# Altium project Baseboard-v2.1.PrjPcb (part 6 of 6)
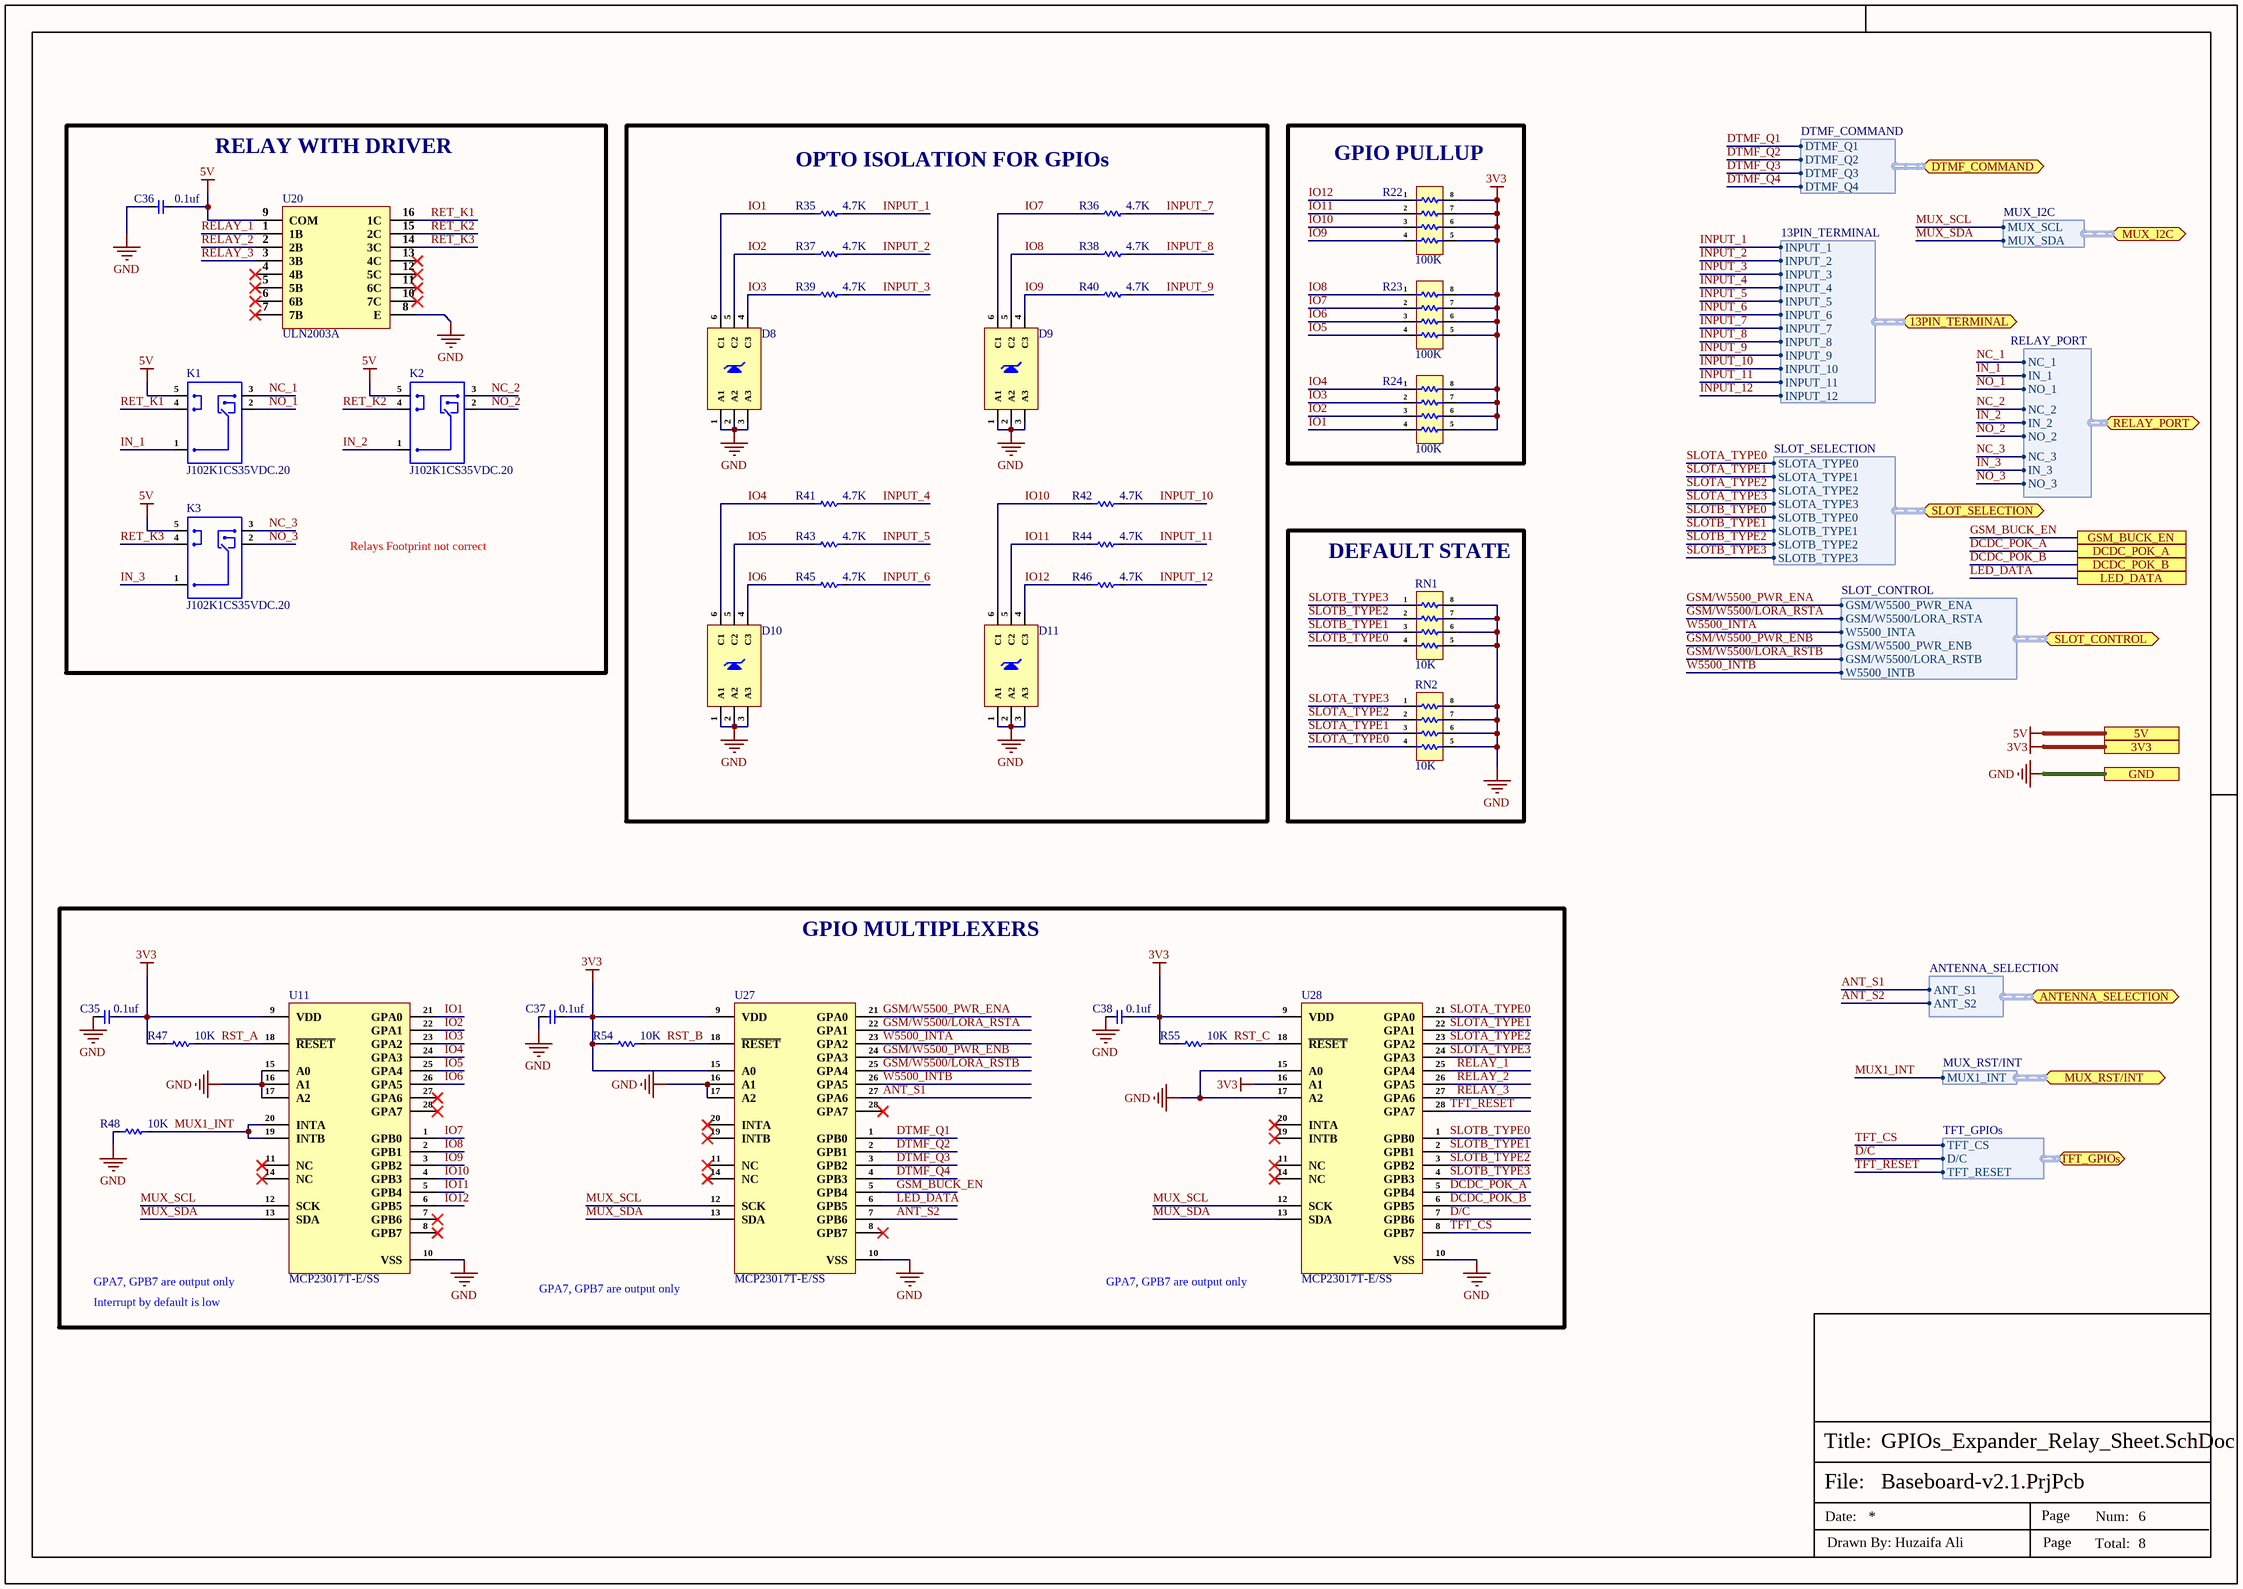
[diagram p8: GPIOs_Expander_Relay_Sheet.SchDoc]

## Nets that join several sheets
3V3: Power_Sheet (5 pins), RS485_RS232_Sheet (13 pins), mPCIe_Connector_Sheet (6 pins), Controller_Sheet (26 pins), GPIOs_Expander_Relay_Sheet (23 pins)
5V: Power_Sheet (11 pins), DTMF_Decoder_Sheet (C32.2 U8.11 U8.20), mPCIe_Connector_Sheet (J20.46 J20.48 J21.46 J21.48), Controller_Sheet (J12.1), GPIOs_Expander_Relay_Sheet (5 pins)
5V_USB: Connector (FB1.2), Power_Sheet (P3.1 U2.6)
GND: Connector (13 pins), Power_Sheet (30 pins), DTMF_Decoder_Sheet (5 pins), RS485_RS232_Sheet (15 pins), mPCIe_Connector_Sheet (48 pins), Controller_Sheet (37 pins), GPIOs_Expander_Relay_Sheet (36 pins)
GSM_PWR: Power_Sheet (7 pins), mPCIe_Connector_Sheet (J20.2 J21.2)
VCC: Connector (D2.2 F2.2 R3.1), Power_Sheet (5 pins)
13PIN_TERMINAL.INPUT_1: Connector (J4.1), GPIOs_Expander_Relay_Sheet (R35.1)
13PIN_TERMINAL.INPUT_2: Connector (J4.2), GPIOs_Expander_Relay_Sheet (R37.1)
13PIN_TERMINAL.INPUT_3: Connector (J4.3), GPIOs_Expander_Relay_Sheet (R39.1)
13PIN_TERMINAL.INPUT_4: Connector (J6.1), GPIOs_Expander_Relay_Sheet (R41.1)
13PIN_TERMINAL.INPUT_5: Connector (J6.2), GPIOs_Expander_Relay_Sheet (R43.1)
13PIN_TERMINAL.INPUT_6: Connector (J6.3), GPIOs_Expander_Relay_Sheet (R45.1)
13PIN_TERMINAL.INPUT_7: Connector (J8.1), GPIOs_Expander_Relay_Sheet (R36.1)
13PIN_TERMINAL.INPUT_8: Connector (J8.2), GPIOs_Expander_Relay_Sheet (R38.1)
13PIN_TERMINAL.INPUT_9: Connector (J8.3), GPIOs_Expander_Relay_Sheet (R40.1)
13PIN_TERMINAL.INPUT_10: Connector (J9.1), GPIOs_Expander_Relay_Sheet (R42.1)
13PIN_TERMINAL.INPUT_11: Connector (J9.2), GPIOs_Expander_Relay_Sheet (R44.1)
13PIN_TERMINAL.INPUT_12: Connector (J11.1), GPIOs_Expander_Relay_Sheet (R46.1)
ANT_S1: Controller_Sheet (R85.1), GPIOs_Expander_Relay_Sheet (U27.27)
ANT_S2: Controller_Sheet (R86.1), GPIOs_Expander_Relay_Sheet (U27.7)
D/C: Controller_Sheet (J12.15), GPIOs_Expander_Relay_Sheet (U28.7)
DCDC_POK_A: mPCIe_Connector_Sheet (J21.8), GPIOs_Expander_Relay_Sheet (U28.5)
DCDC_POK_B: mPCIe_Connector_Sheet (J20.8), GPIOs_Expander_Relay_Sheet (U28.6)
DTMF+: Connector (J14.2), DTMF_Decoder_Sheet (C33.2 R88.2)
DTMF-: Connector (J14.1), DTMF_Decoder_Sheet (C34.2 R89.2)
DTMF_PWM: DTMF_Decoder_Sheet (R91.2), Controller_Sheet (U6.48)
DTMF_Q1: DTMF_Decoder_Sheet (U8.12), GPIOs_Expander_Relay_Sheet (U27.1)
DTMF_Q2: DTMF_Decoder_Sheet (U8.13), GPIOs_Expander_Relay_Sheet (U27.2)
DTMF_Q3: DTMF_Decoder_Sheet (U8.14), GPIOs_Expander_Relay_Sheet (U27.3)
DTMF_Q4: DTMF_Decoder_Sheet (U8.15), GPIOs_Expander_Relay_Sheet (U27.4)
DTMF_STD: DTMF_Decoder_Sheet (U8.17), Controller_Sheet (U6.43)
GSM/W5500/LORA_RSTA: mPCIe_Connector_Sheet (J21.7), GPIOs_Expander_Relay_Sheet (U27.22)
GSM/W5500/LORA_RSTB: mPCIe_Connector_Sheet (J20.7), GPIOs_Expander_Relay_Sheet (U27.25)
GSM/W5500_PWR_ENA: mPCIe_Connector_Sheet (J21.1), GPIOs_Expander_Relay_Sheet (U27.21)
GSM/W5500_PWR_ENB: mPCIe_Connector_Sheet (J20.1), GPIOs_Expander_Relay_Sheet (U27.24)
GSM_BUCK_EN: Power_Sheet (R13.2 U4.1), GPIOs_Expander_Relay_Sheet (U27.5)
IN_1: Connector (J1.2), GPIOs_Expander_Relay_Sheet (K1.1)
IN_2: Connector (J2.2), GPIOs_Expander_Relay_Sheet (K2.1)
IN_3: Connector (J7.2), GPIOs_Expander_Relay_Sheet (K3.1)
LED_DATA: Controller_Sheet (J12.8), GPIOs_Expander_Relay_Sheet (U27.6)
LORA_IO0: mPCIe_Connector_Sheet (J20.10 J21.10), Controller_Sheet (U6.13)
MUX1_INT: Controller_Sheet (U6.14), GPIOs_Expander_Relay_Sheet (R48.1 U11.19 U11.20)
MUX_I2C.MUX_SCL: mPCIe_Connector_Sheet (J20.30 J21.30), Controller_Sheet (R16.1 U6.45), GPIOs_Expander_Relay_Sheet (U11.12 U27.12 U28.12)
MUX_I2C.MUX_SDA: mPCIe_Connector_Sheet (J20.32 J21.32), Controller_Sheet (R15.1 U6.44), GPIOs_Expander_Relay_Sheet (U11.13 U27.13 U28.13)
NC_1: Connector (J1.1), GPIOs_Expander_Relay_Sheet (K1.3)
NC_2: Connector (J2.1), GPIOs_Expander_Relay_Sheet (K2.3)
NC_3: Connector (J7.1), GPIOs_Expander_Relay_Sheet (K3.3)
NO_1: Connector (J1.3), GPIOs_Expander_Relay_Sheet (K1.2)
NO_2: Connector (J2.3), GPIOs_Expander_Relay_Sheet (K2.2)
NO_3: Connector (J7.3), GPIOs_Expander_Relay_Sheet (K3.2)
RE/DE/RS485: RS485_RS232_Sheet (U33.2), Controller_Sheet (U6.22)
RS232_RX: Connector (J13.2), RS485_RS232_Sheet (F22.1)
RS232_TX: Connector (J13.3), RS485_RS232_Sheet (F19.1)
RS485_N: Connector (J10.2), RS485_RS232_Sheet (F20.2)
RS485_P: Connector (J10.3), RS485_RS232_Sheet (F21.2)
RXD/RS485/RS232: RS485_RS232_Sheet (R79.2), Controller_Sheet (U6.23)
RXD/SLOTB_UART_RX: mPCIe_Connector_Sheet (J20.11), Controller_Sheet (J17.4 U6.50)
SLOTA_CS: mPCIe_Connector_Sheet (J21.37), Controller_Sheet (U6.12)
SLOTA_MISO: mPCIe_Connector_Sheet (J21.41), Controller_Sheet (J12.12 U6.10)
SLOTA_MOSI: mPCIe_Connector_Sheet (J21.43), Controller_Sheet (J12.13 U6.11)
SLOTA_SCLK: mPCIe_Connector_Sheet (J21.39), Controller_Sheet (J12.11 U6.9)
SLOTA_TYPE0: mPCIe_Connector_Sheet (J21.3), GPIOs_Expander_Relay_Sheet (RN2.4 U28.21)
SLOTA_TYPE1: mPCIe_Connector_Sheet (J21.5), GPIOs_Expander_Relay_Sheet (RN2.3 U28.22)
SLOTA_TYPE2: mPCIe_Connector_Sheet (J21.31), GPIOs_Expander_Relay_Sheet (RN2.2 U28.23)
SLOTA_TYPE3: mPCIe_Connector_Sheet (J21.33), GPIOs_Expander_Relay_Sheet (RN2.1 U28.24)
SLOTA_UART_RX: mPCIe_Connector_Sheet (J21.11), Controller_Sheet (U6.15)
SLOTA_UART_TX: mPCIe_Connector_Sheet (J21.13), Controller_Sheet (U6.16)
SLOTB_CS: mPCIe_Connector_Sheet (J20.37), Controller_Sheet (U6.21)
SLOTB_MISO: mPCIe_Connector_Sheet (J20.41), Controller_Sheet (U6.18)
SLOTB_MOSI: mPCIe_Connector_Sheet (J20.43), Controller_Sheet (U6.19)
SLOTB_SCLK: mPCIe_Connector_Sheet (J20.39), Controller_Sheet (U6.17)
SLOTB_TYPE0: mPCIe_Connector_Sheet (J20.3), GPIOs_Expander_Relay_Sheet (RN1.4 U28.1)
SLOTB_TYPE1: mPCIe_Connector_Sheet (J20.5), GPIOs_Expander_Relay_Sheet (RN1.3 U28.2)
SLOTB_TYPE2: mPCIe_Connector_Sheet (J20.31), GPIOs_Expander_Relay_Sheet (RN1.2 U28.3)
SLOTB_TYPE3: mPCIe_Connector_Sheet (J20.33), GPIOs_Expander_Relay_Sheet (RN1.1 U28.4)
TFT_CS: Controller_Sheet (J12.14), GPIOs_Expander_Relay_Sheet (U28.8)
TFT_RESET: Controller_Sheet (J12.16), GPIOs_Expander_Relay_Sheet (U28.28)
TXD/RS485/RS232: RS485_RS232_Sheet (R80.2), Controller_Sheet (U6.24)
TXD/SLOTB_UART_TX: mPCIe_Connector_Sheet (J20.13), Controller_Sheet (J17.3 R17.2)
USB.USB_N: Connector (R64.2), mPCIe_Connector_Sheet (R67.2 R82.2), Controller_Sheet (R65.2 U6.25)
USB.USB_P: Connector (R63.2), mPCIe_Connector_Sheet (R83.2 R84.2), Controller_Sheet (R66.2 U6.26)
W5500_INTA: mPCIe_Connector_Sheet (J21.45), GPIOs_Expander_Relay_Sheet (U27.23)
W5500_INTB: mPCIe_Connector_Sheet (J20.45), GPIOs_Expander_Relay_Sheet (U27.26)